# EAGLE schematic control_board (EAGLE 9.7.0)
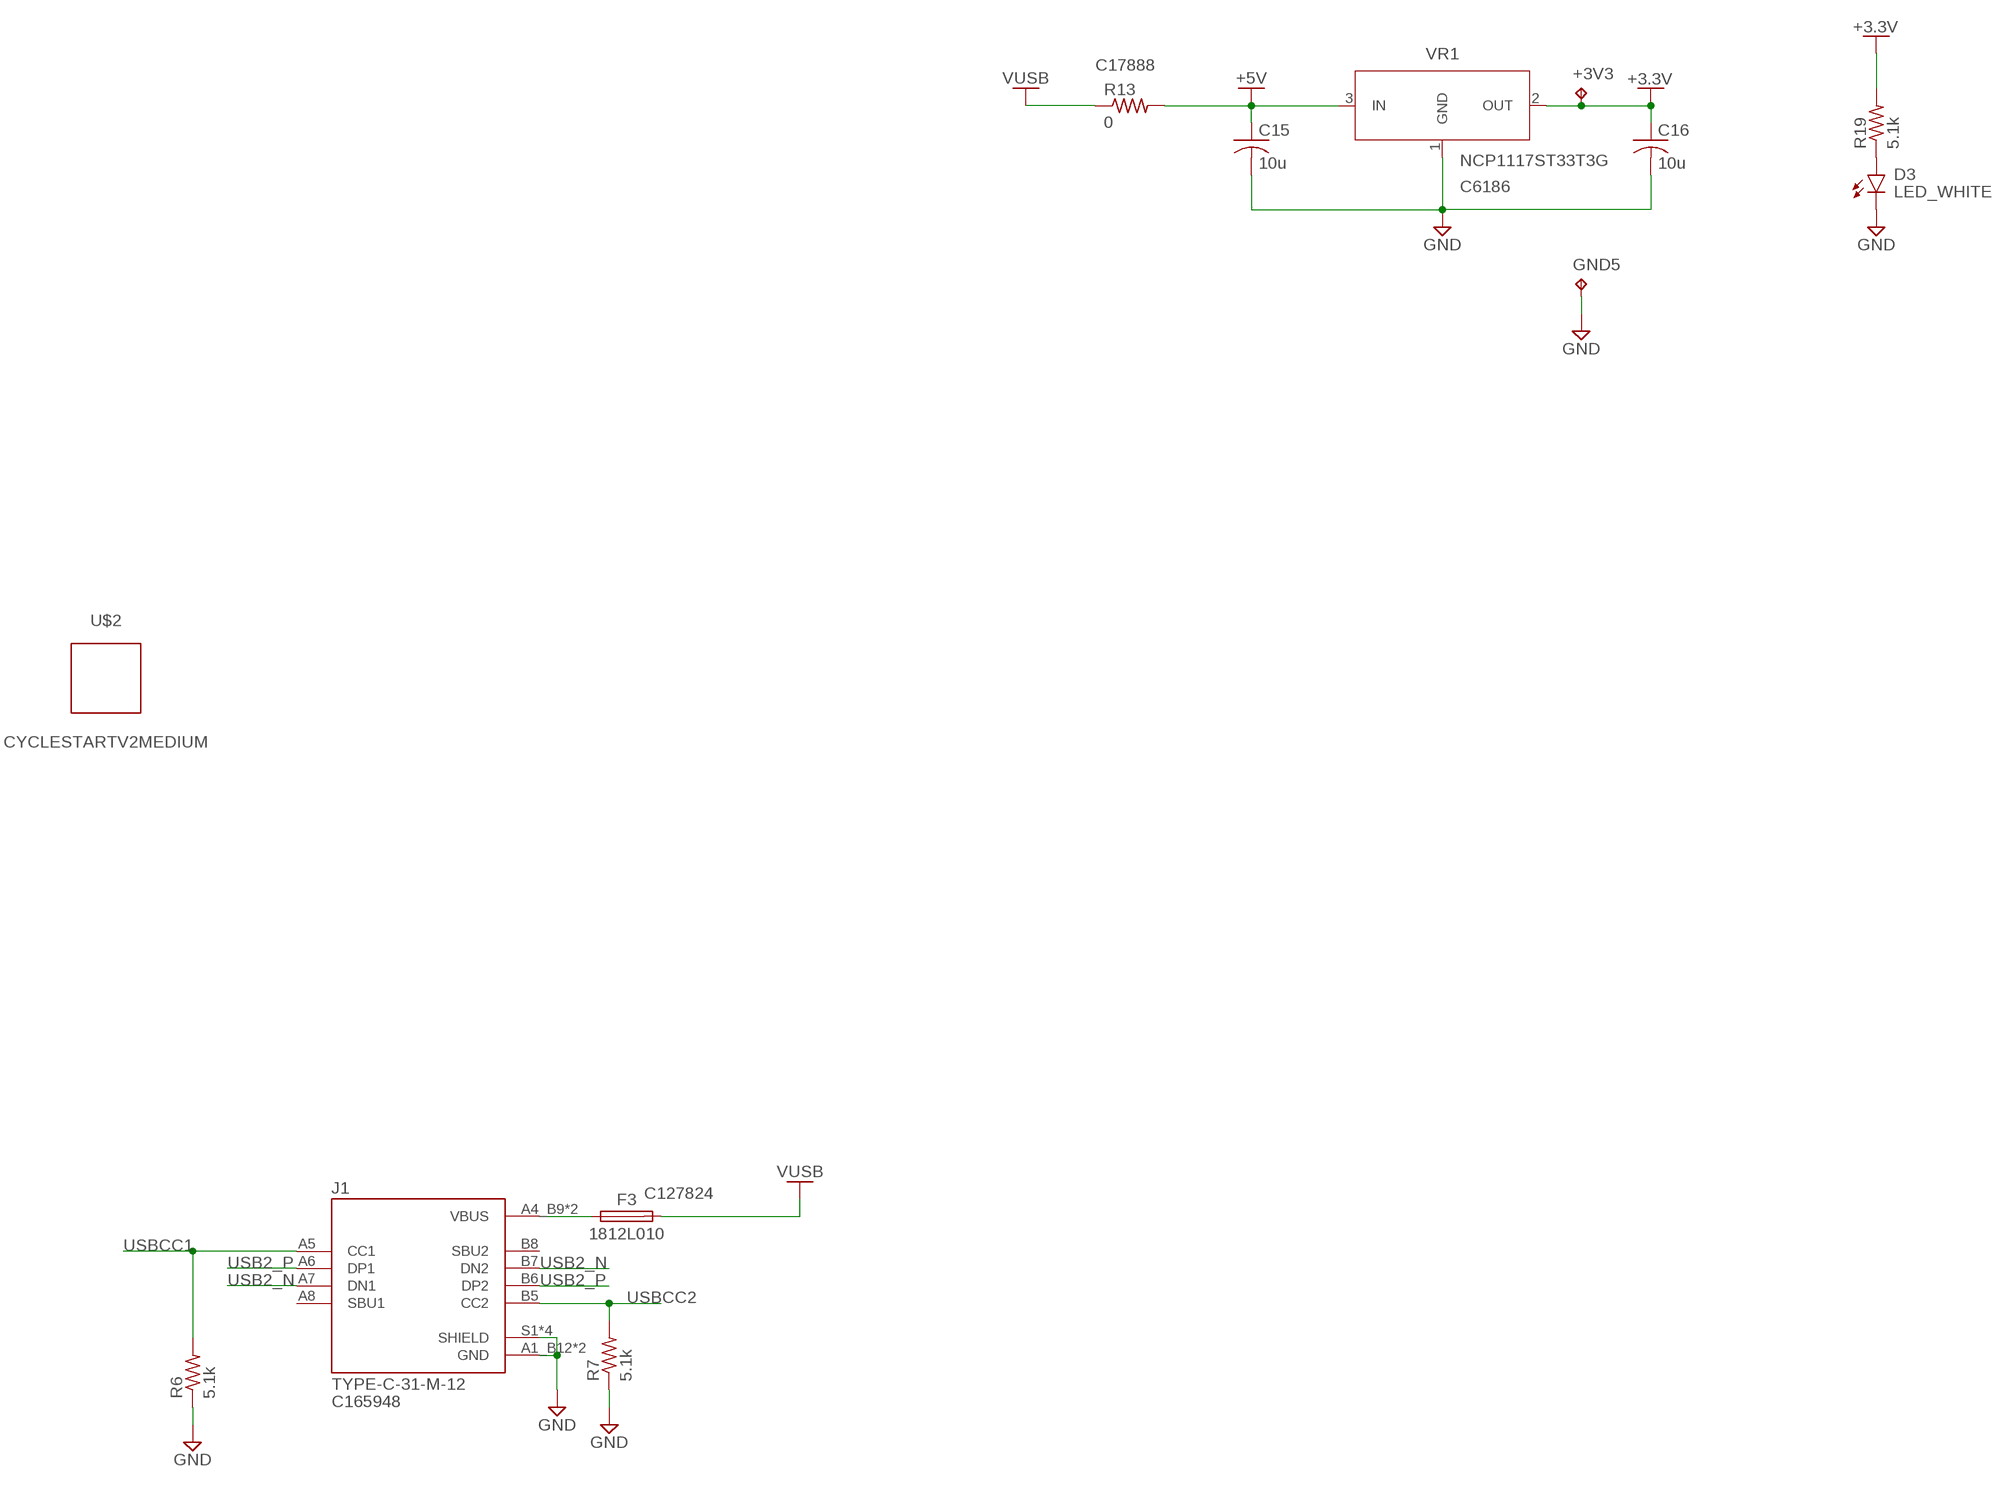
[diagram p0: schematic, sheet 1, part 1 of 2]
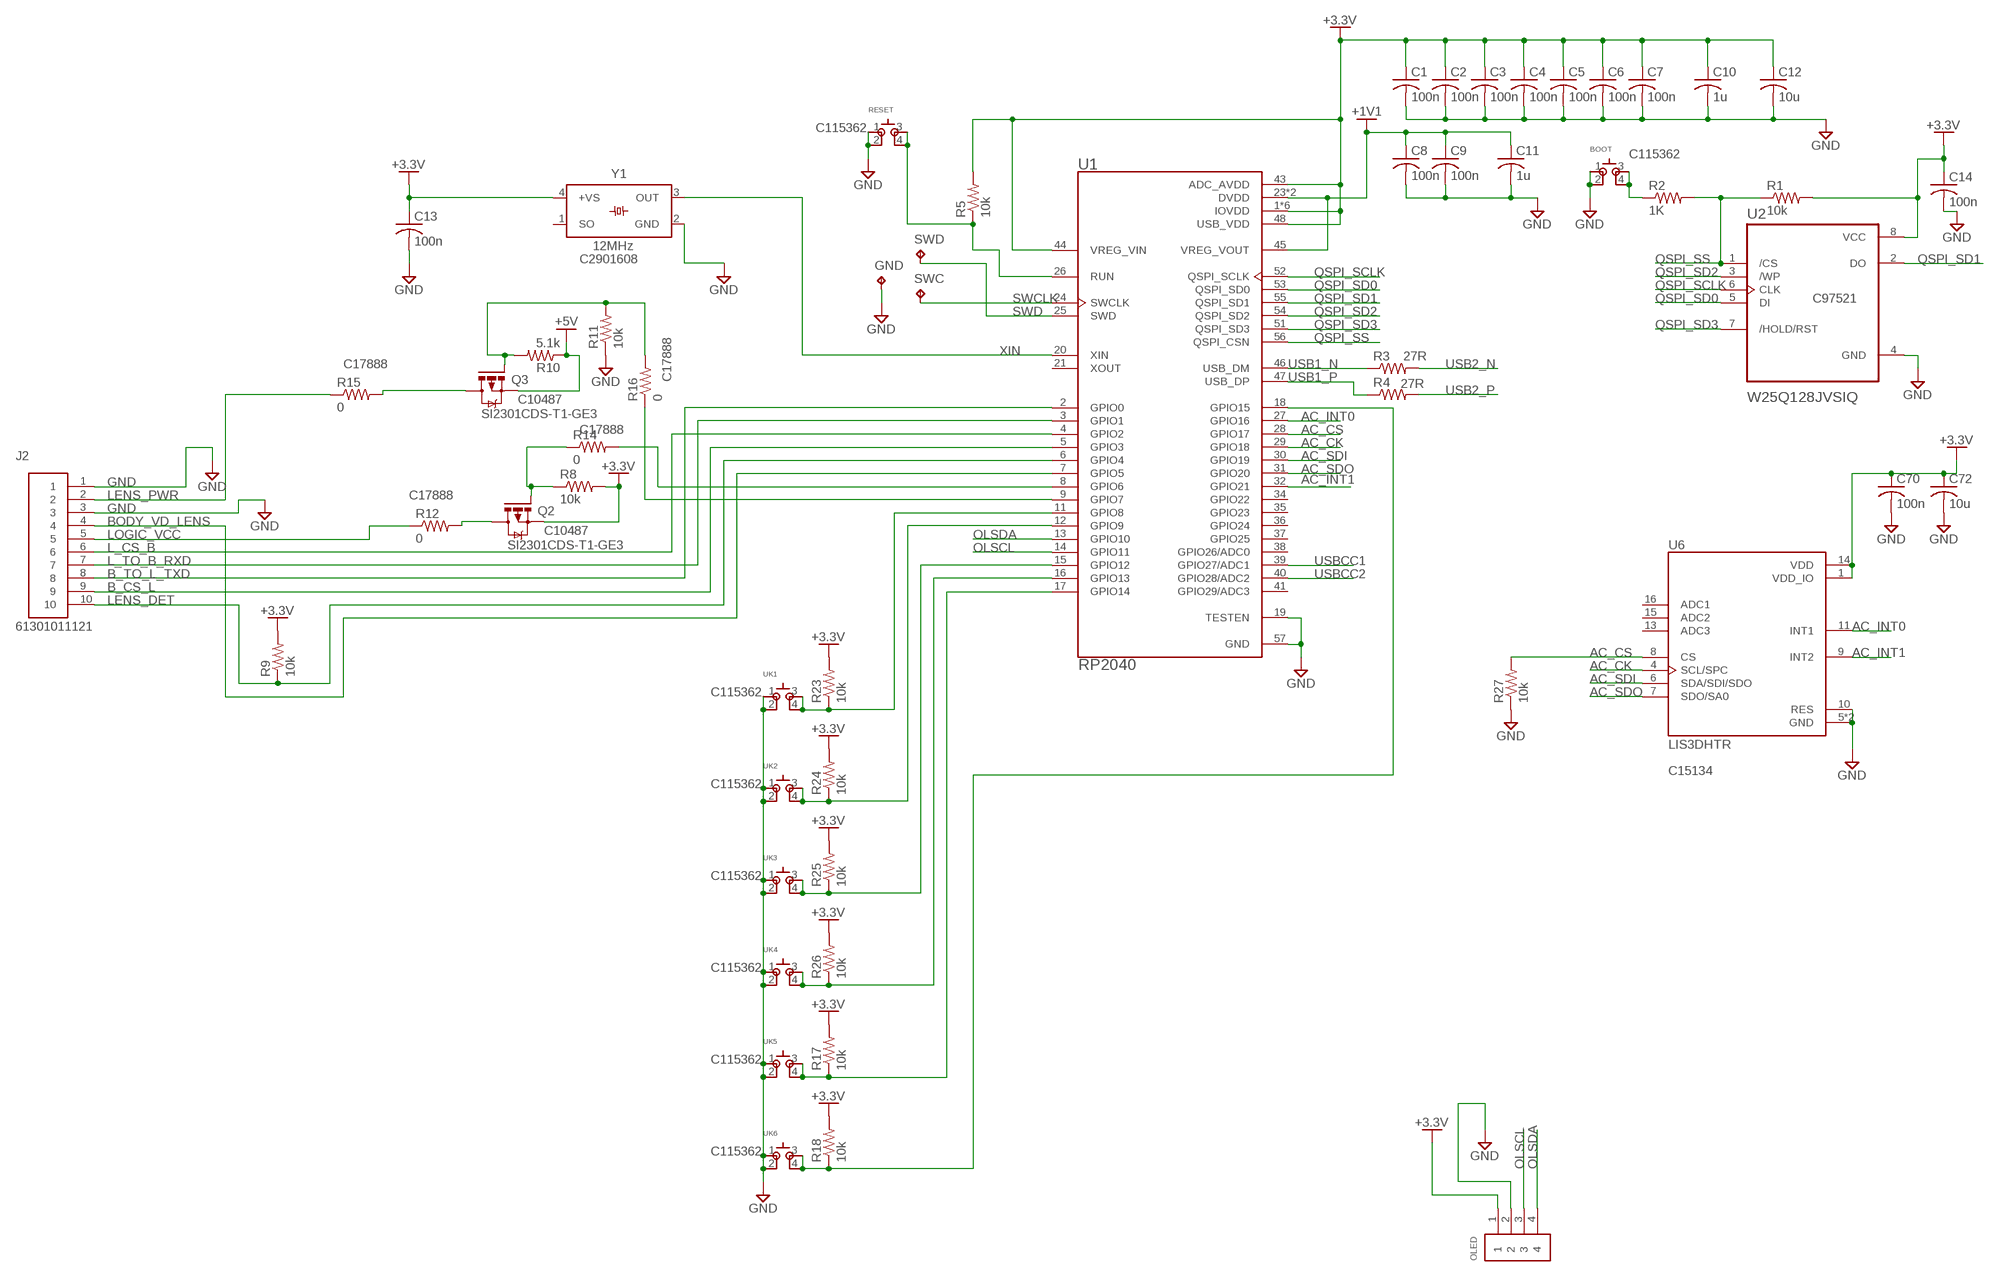
[diagram p1: schematic, sheet 1, part 2 of 2]

## Parts
+3V3  TPB2,54  [B2,54]
BOOT  SKSCLDE010  [SKSCLDE010]
C1  100n  C-USC0603  [C0603]
C2  100n  C-USC0603  [C0603]
C3  100n  C-USC0603  [C0603]
C4  100n  C-USC0603  [C0603]
C5  100n  C-USC0603  [C0603]
C6  100n  C-USC0603  [C0603]
C7  100n  C-USC0603  [C0603]
C8  100n  C-USC0603  [C0603]
C9  100n  C-USC0603  [C0603]
C10  1u  C-USC0603  [C0603]
C11  1u  C-USC0603  [C0603]
C12  10u  C-USC0603  [C0603]
C13  100n  C-USC0603  [C0603]
C14  100n  C-USC0603  [C0603]
C15  10u  C-USC0603  [C0603]
C16  10u  C-USC0603  [C0603]
C70  100n  C-USC0603  [C0603]
C72  10u  C-USC0603  [C0603]
D3  LED_WHITE  CHIP-FLAT-B_0603-0.35MM  [LEDC1608X35N_FLAT-B]
F3  1812L010  [FUSC4532X125]
GND  TPB2,54  [B2,54]
GND5  TPB2,54  [B2,54]
J1  TYPE-C-31-M-12  [HRO_TYPE-C-31-M-12]
J2  61301011121  [61301011121]
OLED  61300411121  [61300411121]
Q2  SI2301CDS-T1-GE3  PMOSFET_IRLML5203_SOT23-GSD  [SOT23]
Q3  SI2301CDS-T1-GE3  PMOSFET_IRLML5203_SOT23-GSD  [SOT23]
R1  10k  R-US_R0603  [R0603]
R2  1K  R-US_R0603  [R0603]
R3  27R  R-US_R0603  [R0603]
R4  27R  R-US_R0603  [R0603]
R5  10k  R-US_R0603  [R0603]
R6  5.1k  R-US_R0603  [R0603]
R7  5.1k  R-US_R0603  [R0603]
R8  10k  R-US_R0603  [R0603]
R9  10k  R-US_R0603  [R0603]
R10  5.1k  R-US_R0603  [R0603]
R11  10k  R-US_R0603  [R0603]
R12  0  R-US_R1206  [R1206]
R13  0  R-US_R1206  [R1206]
R14  0  R-US_R1206  [R1206]
R15  0  R-US_R1206  [R1206]
R16  0  R-US_R1206  [R1206]
R17  10k  R-US_R0603  [R0603]
R18  10k  R-US_R0603  [R0603]
R19  5.1k  R-US_R0603  [R0603]
R23  10k  R-US_R0603  [R0603]
R24  10k  R-US_R0603  [R0603]
R25  10k  R-US_R0603  [R0603]
R26  10k  R-US_R0603  [R0603]
R27  10k  R-US_R0603  [R0603]
RESET  SKSCLDE010  [SKSCLDE010]
SWC  TPB2,54  [B2,54]
SWD  TPB2,54  [B2,54]
U1  RP2040  [QFN40P700X700X90-57N]
U2  W25Q128JVSIQ  W25Q64JVSSIQ  [SOIC127P790X216-8N]
U6  LIS3DHTR  [XDCR_LIS3DHTR]
U$2  CYCLESTARTV2MEDIUM  [CYCLESTARTV2MEDIUM]
UK1  SKSCLDE010  [SKSCLDE010]
UK2  SKSCLDE010  [SKSCLDE010]
UK3  SKSCLDE010  [SKSCLDE010]
UK4  SKSCLDE010  [SKSCLDE010]
UK5  SKSCLDE010  [SKSCLDE010]
UK6  SKSCLDE010  [SKSCLDE010]
VR1  NCP1117ST33T3G  NCP1117ST33T3GSOT-223  [SOT230P700X170-4]
Y1  12MHz  WE-SPXO_IQXO-540_830208214609  [WE-SPXO_IQXO-540]

## Nets
+1V1: C8.1 C9.1 C11.1 U1.23(DVDD) U1.45(VREG_VOUT) U1.50(DVDD)
+3.3V: +3V3.TP C1.1 C2.1 C3.1 C4.1 C5.1 C6.1 C7.1 C10.1 C12.1 C13.1 C14.1 C16.1 C70.1 C72.1 OLED.1 Q2.2(S) R1.2 R5.2 R8.2 R9.2 R17.2 R18.2 R19.2 R23.2 R24.2 R25.2 R26.2 U1.1(IOVDD) U1.10(IOVDD) U1.22(IOVDD) U1.33(IOVDD) U1.42(IOVDD) U1.43(ADC_AVDD) U1.44(VREG_VIN) U1.48(USB_VDD) U1.49(IOVDD) U2.8(VCC) U6.1(VDD_IO) U6.14(VDD) VR1.2(OUT) Y1.4(+VS)
+5V: C15.1 Q3.2(S) R10.1 R13.2 VR1.3(IN)
AC_CK: U1.29(GPIO18) U6.4(SCL/SPC)
AC_CS: R27.2 U1.28(GPIO17) U6.8(CS)
AC_INT0: U1.27(GPIO16) U6.11(INT1)
AC_INT1: U1.32(GPIO21) U6.9(INT2)
AC_SDI: U1.30(GPIO19) U6.6(SDA/SDI/SDO)
AC_SDO: U1.31(GPIO20) U6.7(SDO/SA0)
B_CS_L: J2.9 U1.5(GPIO3)
B_TO_L_TXD: J2.8 U1.2(GPIO0)
BODY_VD_LENS: J2.4 U1.7(GPIO5)
GND: BOOT.1 BOOT.2 C1.2 C2.2 C3.2 C4.2 C5.2 C6.2 C7.2 C8.2 C9.2 C10.2 C11.2 C12.2 C13.2 C14.2 C15.2 C16.2 C70.2 C72.2 D3.C GND5.TP GND.TP J1.A1_B12(GND) J1.B1_A12(GND) J1.S1(SHIELD) J1.S2(SHIELD) J1.S3(SHIELD) J1.S4(SHIELD) J2.1 J2.3 OLED.2 R6.1 R7.1 R11.1 R27.1 RESET.1 RESET.2 U1.19(TESTEN) U1.57(GND) U2.4(GND) U6.5(GND) U6.10(RES) U6.12(GND) UK1.1 UK1.2 UK2.1 UK2.2 UK3.1 UK3.2 UK4.1 UK4.2 UK5.1 UK5.2 UK6.1 UK6.2 VR1.1(GND) Y1.2(GND)
L_CS_B: J2.6 U1.4(GPIO2)
L_TO_B_RXD: J2.7 U1.3(GPIO1)
LENS_DET: J2.10 R9.1 U1.6(GPIO4)
LENS_PWR: J2.2 R15.1
LOGIC_VCC: J2.5 R12.1
N$1: D3.A R19.1
N$2: R14.2 U1.8(GPIO6)
N$3: BOOT.3 BOOT.4 R2.1
N$4: R16.1 U1.9(GPIO7)
N$5: R5.1 RESET.3 RESET.4 U1.26(RUN)
N$6: Q2.3(D) R12.2
N$7: Q2.1(G) R8.1 R14.1
N$8: Q3.3(D) R15.2
N$9: Q3.1(G) R10.2 R11.2 R16.2
N$10: R17.1 U1.17(GPIO14) UK5.3 UK5.4
N$11: R18.1 U1.18(GPIO15) UK6.3 UK6.4
N$17: F3.1 J1.A4_B9(VBUS) J1.B4_A9(VBUS)
N$20: R23.1 U1.11(GPIO8) UK1.3 UK1.4
N$108: R24.1 U1.12(GPIO9) UK2.3 UK2.4
N$109: R25.1 U1.15(GPIO12) UK3.3 UK3.4
N$110: R26.1 U1.16(GPIO13) UK4.3 UK4.4
OLSCL: OLED.3 U1.14(GPIO11)
OLSDA: OLED.4 U1.13(GPIO10)
QSPI_SCLK: U1.52(QSPI_SCLK) U2.6(CLK)
QSPI_SD0: U1.53(QSPI_SD0) U2.5(DI)
QSPI_SD1: U1.55(QSPI_SD1) U2.2(DO)
QSPI_SD2: U1.54(QSPI_SD2) U2.3(/WP)
QSPI_SD3: U1.51(QSPI_SD3) U2.7(/HOLD/RST)
QSPI_SS: R1.1 R2.2 U1.56(QSPI_CSN) U2.1(/CS)
SWCLK: SWC.TP U1.24(SWCLK)
SWD: SWD.TP U1.25(SWD)
USB1_N: R3.1 U1.46(USB_DM)
USB1_P: R4.1 U1.47(USB_DP)
USB2_N: J1.A7(DN1) J1.B7(DN2) R3.2
USB2_P: J1.A6(DP1) J1.B6(DP2) R4.2
USBCC1: J1.A5(CC1) R6.2 U1.39(GPIO27/ADC1)
USBCC2: J1.B5(CC2) R7.2 U1.40(GPIO28/ADC2)
VUSB: F3.2 R13.1
XIN: U1.20(XIN) Y1.3(OUT)
Unconnected: J1.A8(SBU1) J1.B8(SBU2) U1.21(XOUT) U1.34(GPIO22) U1.35(GPIO23) U1.36(GPIO24) U1.37(GPIO25) U1.38(GPIO26/ADC0) U1.41(GPIO29/ADC3) U6.13(ADC3) U6.15(ADC2) U6.16(ADC1) Y1.1(SO)

## Library data of the parts
+3V3 GND GND5 SWC SWD = testpad:TP: Test pad
BOOT RESET UK1-UK6 = alps:SKSCLDE010; JLCPN: C115362
C1-C9 C13 C14 C70 = rcl:C-US: CAPACITOR, American symbol; JLCPN: C14663; SPICEPREFIX: C
C10 C11 = rcl:C-US: CAPACITOR, American symbol; JLCPN: C15849; SPICEPREFIX: C
C12 C15 C16 C72 = rcl:C-US: CAPACITOR, American symbol; JLCPN: C19702; SPICEPREFIX: C
D3 = LED:CHIP-FLAT-B; CATEGORY: LED; COLOR: BLUE; DESCRIPTION: CHIP LED FLAT; JLCPN: C2290; SUB-CATEGORY: CHIP; TYPE: FLAT_TOP; VALUE: LED_BLUE
F3 = Fuse:1812L: 1812L Series PTC provides surface mount overcurrent protection for applications where resettable protection is desired. Datasheet <https://www.littelfuse.com/~/media/electronics/datasheets/resettable_ptcs/littelfuse_ptc_1812l_datasheet.pdf.pdf>; CATEGORY: FUSE; DESCRIPTION: Resettable PTCs; JLCPN: C127824; MANUFACTURER: Littlefuse; MPN: 1812L010; OPERATING_TEMPERATURE: -40°C to +85°C; PART_STATUS: ACTIVE; ROHS_COMPLIANCE: RoHS Compliant; SERIES: 1812L; SUBCATEGORY: Resettable; TYPE: PTC
J1 = SnapEDA Library:TYPE-C-31-M-12; JLCPN: C165948; MANUFACTURER: HRO Electronics Co., Ltd.; MAXIMUM_PACKAGE_HEIGHT: 3.26 mm; PARTREV: 2020.12.08; SNAPEDA_PN: TYPE-C-31-M-12; STANDARD: Manufacturer Recommendations
J2 = Headers:61301011121: CONN HEADER VERT 10POS 2.54MM Manufacturer's datasheet <https://katalog.we-online.de/em/datasheet/6130xx11121.pdf>; CREATED_BY: PCBLayout.com; DIGIKEY_PART_NUMBER: 732-2670-ND; MANUFACTURER: Wurth Electronics Inc.; MPN: 61301011121
OLED = Headers:61300411121: CONN HEADER VERT 4POS 2.54MM Manufacturer's datasheet <https://katalog.we-online.de/em/datasheet/6130xx11121.pdf>; CREATED_BY: PCBLayout.com; DIGI_KEY_PART_NUMBER: 732-5317-ND; MANUFACTURER: Wurth Electronics Inc.; MPN: 61300411121
Q2 Q3 = Transistor:PMOSFET_: P-Channel MOSFET - Popular parts; CATEGORY: Transistor; DESCRIPTION: MOSFET P-CH 30V 3A SOT-23; DRAIN_CURRENT: 3A; JLCPN: C10487; MANUFACTURER: Infineon Technologies; MPN: IRLML5203TRPBF; OPERATING_TEMP: -55°C ~ 150°C; PART_STATUS: Active; ROHS_COMPLIANT: Yes; SUB-CATEGORY: MOSFET; THERMALLOSS: 1.25W; TYPE: P-Channel; VALUE: IRLML5203
R1 R5 R8 R9 R11 R17 R18 R23-R27 = rcl:R-US_: RESISTOR, American symbol; JLCPN: C25804; SPICEPREFIX: R
R2 = rcl:R-US_: RESISTOR, American symbol; JLCPN: C21190; SPICEPREFIX: R
R3 R4 = rcl:R-US_: RESISTOR, American symbol; JLCPN: C2907021; SPICEPREFIX: R
R6 R7 R10 R19 = rcl:R-US_: RESISTOR, American symbol; JLCPN: C23186; SPICEPREFIX: R
R12-R16 = rcl:R-US_: RESISTOR, American symbol; JLCPN: C17888; SPICEPREFIX: R
U1 = SnapEDA Library:RP2040; JLCPN: C2040; MANUFACTURER: Raspberry Pi; MAXIMUM_PACKAGE_HEIGHT: 0.9 mm; PARTREV: 1.6.1; STANDARD: IPC 7351B
U2 = SnapEDA Library:W25Q64JVSSIQ: None; JLCPN: C97521; MANUFACTURER: Winbond Electronics; PACKAGE: SOIC127P790X216-8N
U6 = LIS3DHTR:LIS3DHTR: MEMS digital output motion sensor ultra low-power high performance 3-axes "nano" accelerometer Check availability <https://pricing.snapeda.com/parts/LIS3DHTR/STMicroelectronics/view-part?ref=eda>; AVAILABILITY: In Stock; CHECK_PRICES: https://www.snapeda.com/parts/LIS3DHTR/STMicroelectronics/view-part/?ref=eda; DESCRIPTION: Accelerometer X, Y, Z Axis ±2g, 4g, 8g, 16g 0.5Hz ~ 625Hz 16-LGA (3x3); JLCPN: C15134; MF: STMicroelectronics; MP: LIS3DHTR; PACKAGE: LGA-16 STMicroelectronics; PRICE: None; PURCHASE-URL: https://www.snapeda.com/api/url_track_click_mouser/?unipart_id=278195&manufacturer=STMicroelectronics&part_name=LIS3DHTR&search_term=None; SNAPEDA_LINK: https://www.snapeda.com/parts/LIS3DHTR/STMicroelectronics/view-part/?ref=snap
U$2 = Logos:CYCLESTARTV2
VR1 = IC_Power-Management:NCP1117ST33T3G: 1.0 A Low-Dropout Positive Fixed and Adjustable Voltage Regulators Datasheet <https://www.onsemi.com/pub/Collateral/NCP1117-D.PDF>; CATEGORY: IC_Power-Management; JLCPN: C6186; MANUFACTURER: ON Semiconductor; MPN: NCP1117ST33T3G; OPERATING_TEMP: 0 to +125 °C; PART_STATUS: Active; ROHS_COMPLIANT: RoHS3 Compliant; SERIES: NCP1117, NCV1117; SUB-CATEGORY: Voltage Regulator; TYPE: Linear
Y1 = Wurth_Quartz Crystals & Oscillators_WE-SPXO:WE-SPXO_IQXO-540: WE-SPXO Simple Packaged Quartz Oscillator Characteristics SMT models Hermetically sealed Frequencies between 3.6864 MHz and 125 MHz Maximum operating temperatures range:-40 °C to 85 °C Stabilities down to ± 25 ppm available Available supply voltages: 1.8 V, 3.3 V and 5 V Available output signal types: CMOS; HCMOS; HCMOS/TTL Applications Microprocessor Wireless Communication Devices Industrial Devices Real Time Clocks Wired Communication (e.g. Ethernet and USB) IoT Optical Network Audio and Multimedia Devices Test and Measurement Equipment Navigation and Locators <https://www.we-online.com/catalog/media/o135918v209%20Family_WE-SPXO.jpg> Details see: https://www.we-online.com/catalog/en/WE-SPXO Updated by Ella Wu, 2019-09-03 2019 (C) Wurth Elektronik; DATASHEET-URL: https://www.we-online.com/catalog/datasheet/830208214609.pdf; JLCPN: C2901608; MOUNT: SMT; PART-NUMBER: 830208214609; STABILITY: 25ppm; V-SUPPLY: 3.3V; VALUE: 4.0MHz